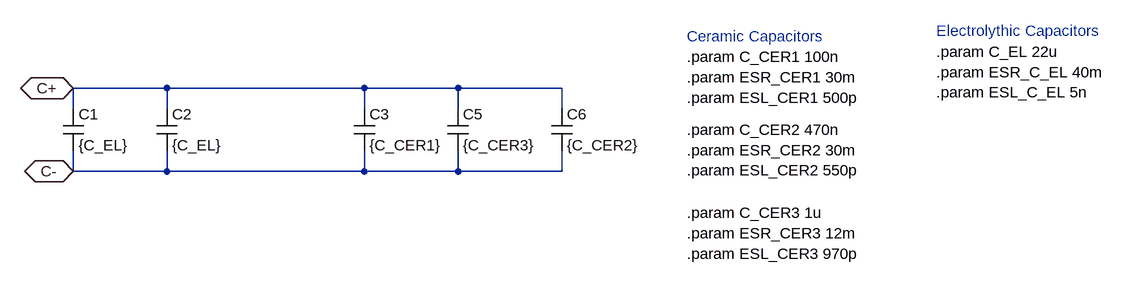
[diagram p0: schematic stack_cap.asc]
stack_cap.asc, the LTspice schematic file:
Version 4.1
SHEET 1 2304 692
WIRE 272 112 128 112
WIRE 576 112 272 112
WIRE 720 112 576 112
WIRE 880 112 720 112
WIRE 128 144 128 112
WIRE 272 144 272 112
WIRE 576 144 576 112
WIRE 720 144 720 112
WIRE 880 144 880 112
WIRE 128 240 128 208
WIRE 272 240 272 208
WIRE 272 240 128 240
WIRE 576 240 576 208
WIRE 576 240 272 240
WIRE 720 240 720 208
WIRE 720 240 576 240
WIRE 880 240 880 208
WIRE 880 240 720 240
FLAG 128 112 C+
IOPIN 128 112 BiDir
FLAG 128 240 C-
IOPIN 128 240 BiDir
SYMBOL cap 112 144 R0
SYMATTR InstName C1
SYMATTR Value {C_EL}
SYMATTR SpiceLine Rser={ESR_C_EL} Lser={ESL_C_EL}
SYMBOL cap 256 144 R0
SYMATTR InstName C2
SYMATTR Value {C_EL}
SYMATTR SpiceLine Rser={ESR_C_EL} Lser={ESL_C_EL}
SYMBOL cap 560 144 R0
SYMATTR InstName C3
SYMATTR Value {C_CER1}
SYMATTR SpiceLine Rser={ESR_CER1} Lser={ESL_CER1}
SYMBOL cap 704 144 R0
SYMATTR InstName C5
SYMATTR Value {C_CER3}
SYMATTR SpiceLine Rser={ESR_CER3} Lser={ESL_CER3}
SYMBOL cap 864 144 R0
SYMATTR InstName C6
SYMATTR Value {C_CER2}
SYMATTR SpiceLine Rser={ESR_CER2} Lser={ESL_CER2}
TEXT 1456 56 Left 2 !.param C_EL 22u\n.param ESR_C_EL 40m\n.param ESL_C_EL 5n
TEXT 1072 64 Left 2 !.param C_CER1 100n\n.param ESR_CER1 30m\n.param ESL_CER1 500p
TEXT 1072 304 Left 2 !.param C_CER3 1u\n.param ESR_CER3 12m\n.param ESL_CER3 970p
TEXT 1072 176 Left 2 !.param C_CER2 470n\n.param ESR_CER2 30m\n.param ESL_CER2 550p
TEXT 1072 32 Left 2 ;Ceramic Capacitors
TEXT 1456 24 Left 2 ;Electrolythic Capacitors

The netlist it stands for:
* stack_cap.asc
C1 C+ C- {C_EL} Rser={ESR_C_EL} Lser={ESL_C_EL}
C2 C+ C- {C_EL} Rser={ESR_C_EL} Lser={ESL_C_EL}
C3 C+ C- {C_CER1} Rser={ESR_CER1} Lser={ESL_CER1}
C5 C+ C- {C_CER3} Rser={ESR_CER3} Lser={ESL_CER3}
C6 C+ C- {C_CER2} Rser={ESR_CER2} Lser={ESL_CER2}
.param C_EL 22u
.param ESR_C_EL 40m
.param ESL_C_EL 5n
.param C_CER1 100n
.param ESR_CER1 30m
.param ESL_CER1 500p
.param C_CER3 1u
.param ESR_CER3 12m
.param ESL_CER3 970p
.param C_CER2 470n
.param ESR_CER2 30m
.param ESL_CER2 550p
* Ceramic Capacitors
* Electrolythic Capacitors
.backanno
.end